# Altium schematic sheet STPMotorControl7_1.SchDoc
size A4; SheetNumber: 6; SheetTotal: 6
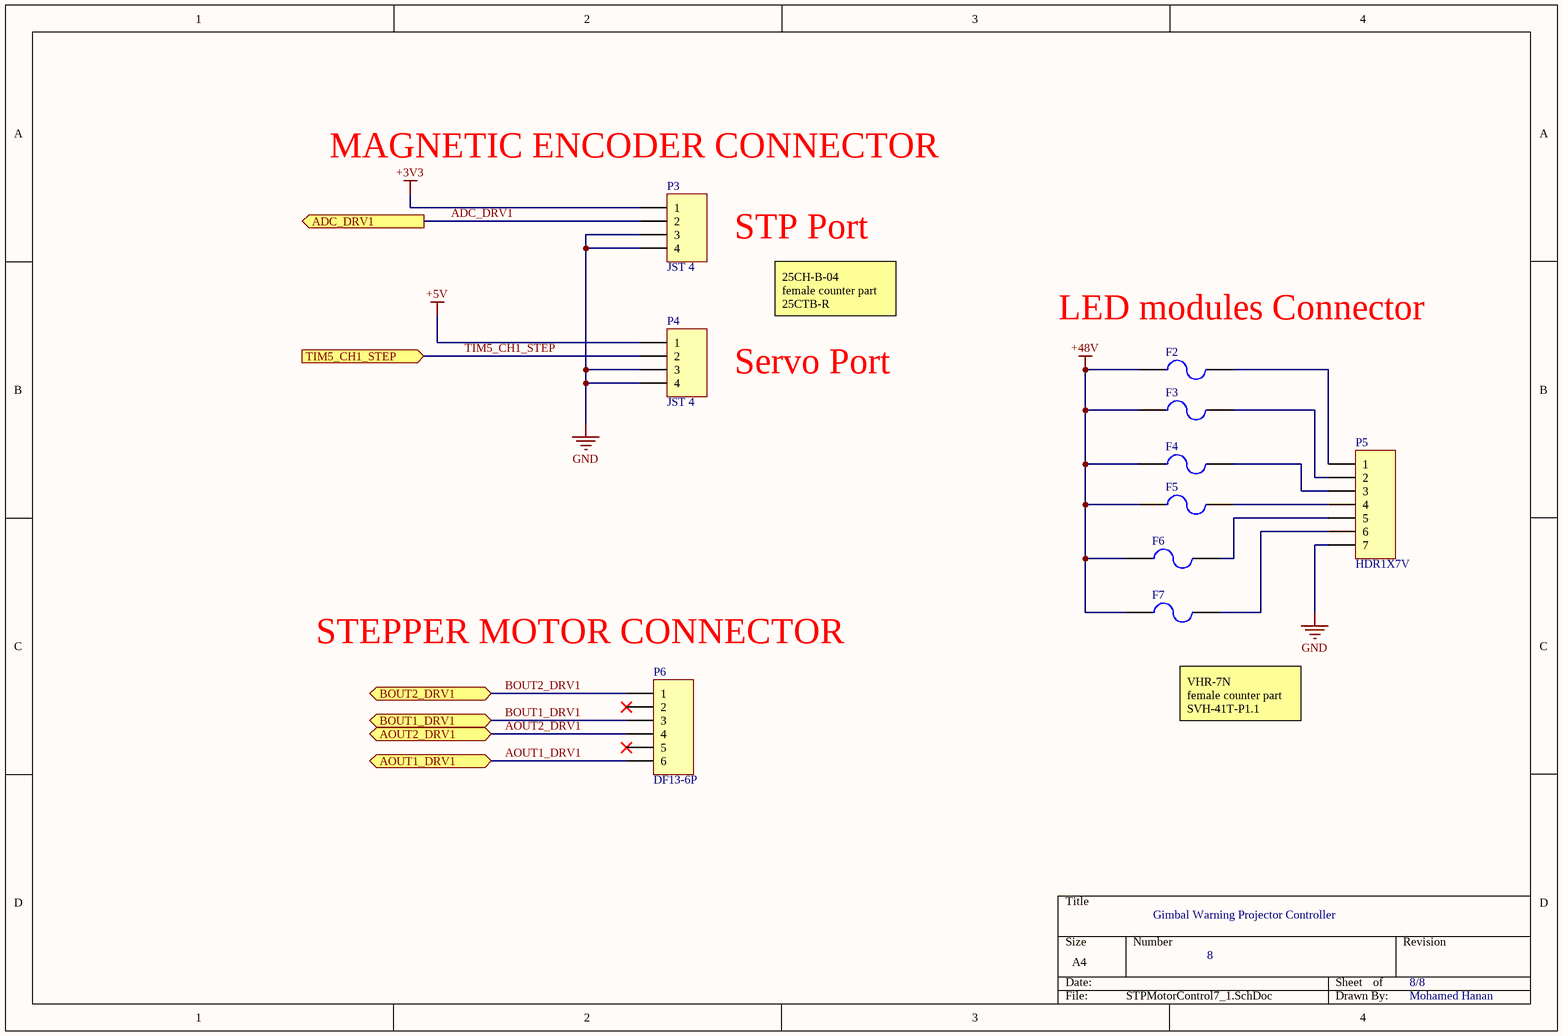
[diagram p0: STPMotorControl7_1.SchDoc]

## Parts
F2  1206L035/16YR  [MC36207]  (value not drawn)
F3  1206L035/16YR  [MC36207]  (value not drawn)
F4  1206L035/16YR  [MC36207]  (value not drawn)
F5  1206L035/16YR  [MC36207]  (value not drawn)
F6  1206L035/16YR  [MC36207]  (value not drawn)
F7  1206L035/16YR  [MC36207]  (value not drawn)
P3  JST 4  [XA-4]
P4  JST 4  [XA-4]
P5  HDR1X7V  [HDR1X7_AUT]
P6  DF13-6P  [DF13-6]

## Ports
ADC_DRV1 (out, see STPMotorConnections[3C], STPMotorControl_1[1C]), AOUT1_DRV1 (bidir, see STPMotorConnections[3C], STPMotorControl4_1[1B]), AOUT2_DRV1 (bidir, see STPMotorConnections[3C], STPMotorControl4_1[1B]), BOUT1_DRV1 (bidir, see STPMotorConnections[3C], STPMotorControl4_1[1B]), BOUT2_DRV1 (bidir, see STPMotorConnections[3C], STPMotorControl4_1[1C]), TIM5_CH1_STEP (in, see STPMotorConnections[3C], STPMotorControl_1[3A])

## Nets
+3V3: P3.1
+5V: P4.1
+48V: F2.1 F3.1 F4.1 F5.1 F6.1 F7.1
GND: P3.3 P3.4 P4.3 P4.4 P5.7
ADC_DRV1: P3.2 ; port ADC_DRV1
AOUT1_DRV1: P6.6 ; port AOUT1_DRV1
AOUT2_DRV1: P6.4 ; port AOUT2_DRV1
BOUT1_DRV1: P6.3 ; port BOUT1_DRV1
BOUT2_DRV1: P6.1 ; port BOUT2_DRV1
TIM5_CH1_STEP: P4.2 ; port TIM5_CH1_STEP
NetF2_2: F2.2 P5.1
NetF3_2: F3.2 P5.2
NetF4_2: F4.2 P5.3
NetF5_2: F5.2 P5.4
NetF6_2: F6.2 P5.5
NetF7_2: F7.2 P5.6

Not connected (* = marked no-connect by the designer): P6 2* 5*

## Notes on the sheet
- (near P3) MAGNETIC ENCODER CONNECTOR
- STP Port
- 25CH-B-04
  female counter part
  25CTB-R
- Servo Port
- (near F2) LED modules Connector
- (near P6) STEPPER MOTOR CONNECTOR
- VHR-7N
  female counter part
  SVH-41T-P1.1
- Gimbal Warning Projector Controller
- 8
- 8/8
- Mohamed Hanan

## Library data of the parts
F2-F7 = 1206L035/16YR: Fuse, PTC Reset, 350mA Hold, 750mA Tripping, 16v; Supplier 1: Element14; Supplier Part Number 1: 1822203
P3 P4 = JST XA Header 4: JST XA Header, 4-Pin, Pitch 2.5mm; Supplier 1: Farnell; Supplier Part Number 1: 9492089
P5 = HDR1X7V: Header, Plug, 2.54mm, 7 Pins, Straight; Supplier 1: Farnell; Supplier Part Number 1: 9731121
P6 = DF13-6P: HIROSE(HRS)  DF13-6P-1.25H(20)  Wire-To-Board Connector, Right Angle, DF13 Series, Surface Mount, Header, 6 Contacts, 1.25 mm; Supplier 1: Farnell; Supplier Part Number 1: 1324928